# Altium project TYPEC_4KRECEIVER-v1.0.PrjPcb (part 6 of 12)

## Sheet RK3566_SARADC_GPIO.SchDoc
size A4; SheetNumber: 12; SheetTotal: 23
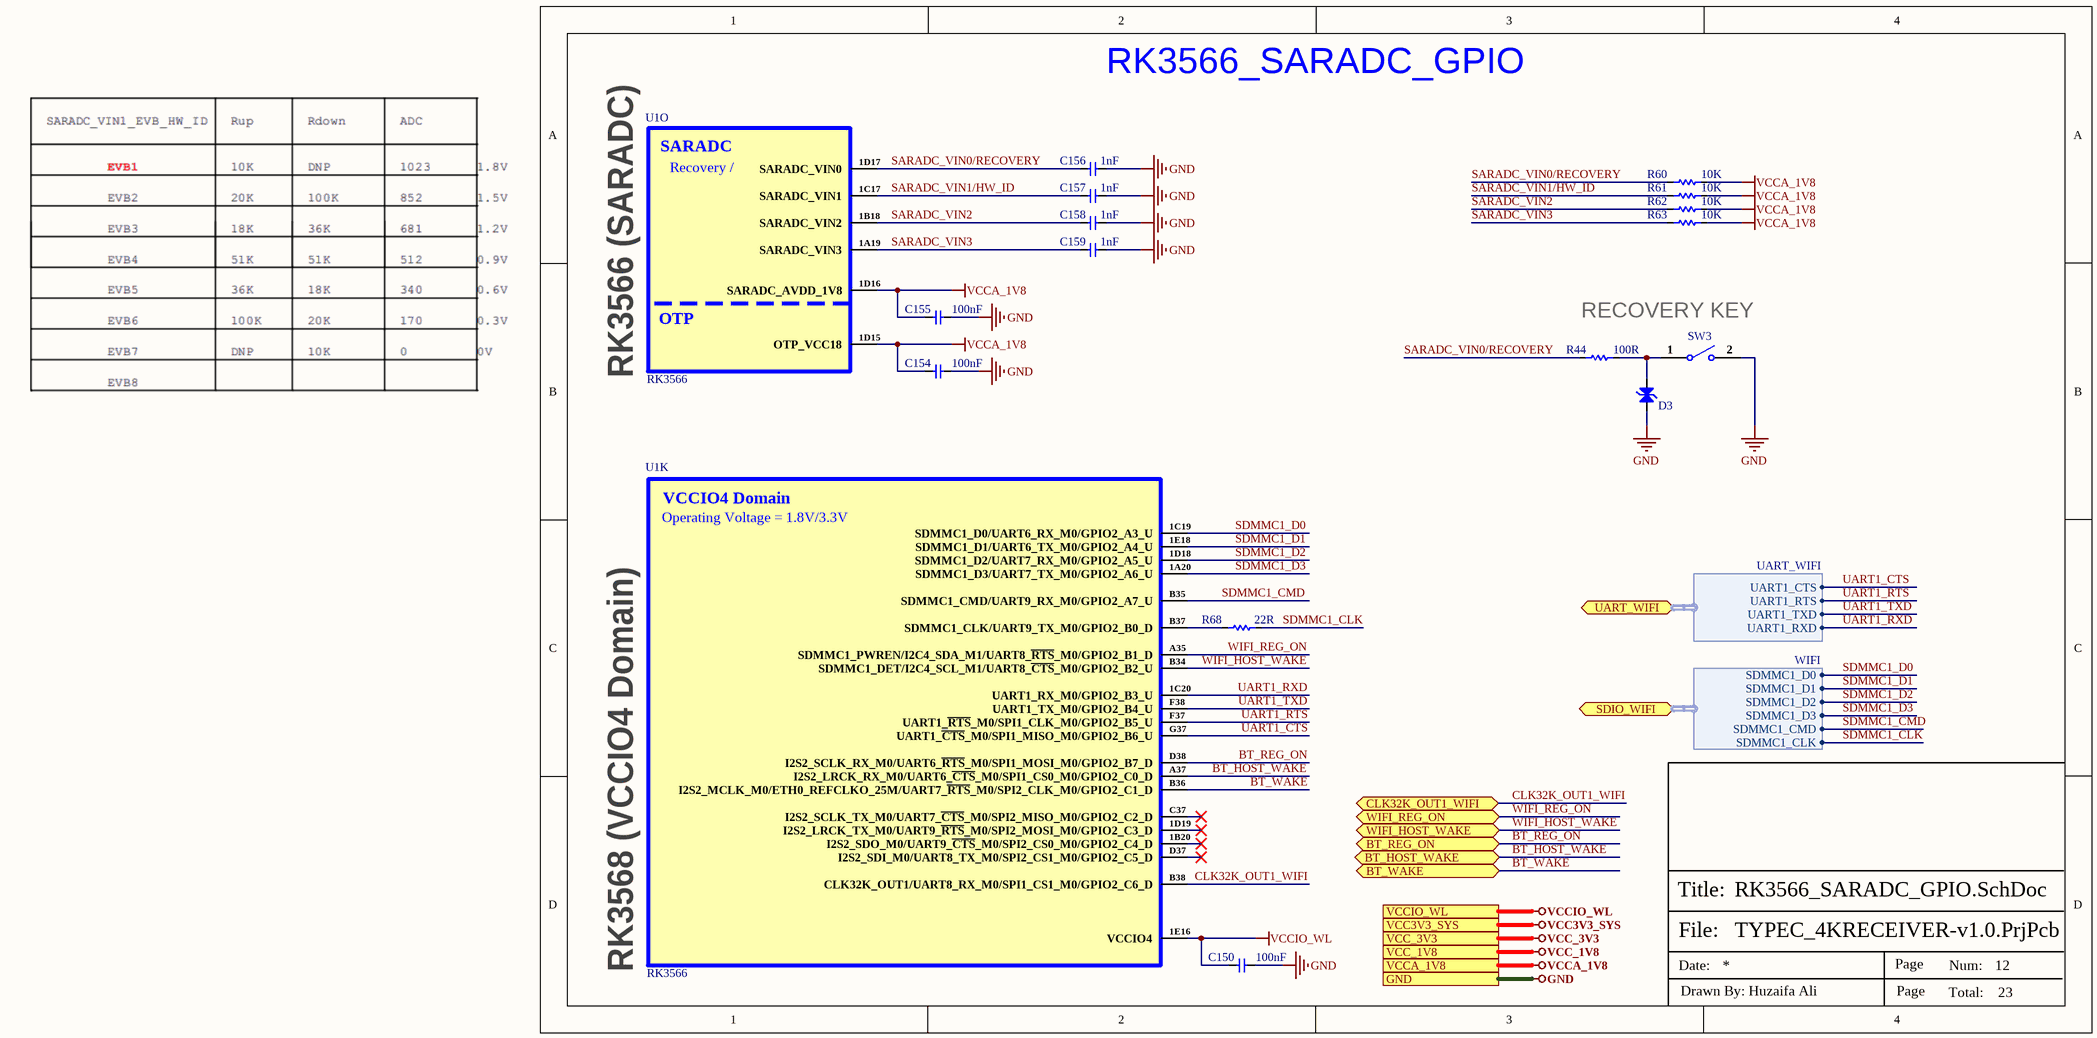
[diagram p12: RK3566_SARADC_GPIO.SchDoc]

### Parts
C150  100nF  [CAP-0201]
C154  100nF  [CAP-0201]
C155  100nF  [CAP-0201]
C156  1nF  [CAP-0201]
C157  1nF  [CAP-0201]
C158  1nF  [CAP-0201]
C159  1nF  [CAP-0201]
D3  ESD5451N  [DFN1006-2L (Bi-Directional)]  (value not drawn)
R44  100R  [Res-0402]
R60  10K  [Res-0201]
R61  10K  [Res-0201]
R62  10K  [Res-0201]
R63  10K  [Res-0201]
R68  22R  [Res-0402]
SW3  B3U-1000P  [B3U-1000P]  (value not drawn)
U1  RK3566  [BGA-565(15.5x14.4)]  (parts K,O of 22)

### Ports
BT_HOST_WAKE (bidir, see WIFI-6_SHEET[3D]), BT_REG_ON (bidir, see WIFI-6_SHEET[3D]), BT_WAKE (bidir, see WIFI-6_SHEET[3D]), CLK32K_OUT1_WIFI (bidir, see WIFI-6_SHEET[3D]), GND (see DRAM_LPDDR4_SHEET[6D], eMMC_SPI-FLASH_SHEET[1D], HDMI2.0_SHEET[3D], POWER_LDO_SHEET[3D], POWER_OTHER_SHEET[3C], POWER_PMIC_RK809_CODEC[3C], POWER_PMIC_RK809_DC DC[3D], POWER_PMIC_RK809_LDO[4C], POWER_PMIC_RK809_MGM[3D], RK3566_AUDIO_SHEET[3C], RK3566_DDR-PHY_SHEET[5D], RK3566_FLASH-SD_SHEET[4C], RK3566_OSC_PMUIO_SHEET[5D], RK3566_POWER_SHEET[3D], RK3566_USB_PCIe_SHEET[3D], RK3566_VI_SHEET[3D], RK3566_VO_SHEET_1[3C], RK3566_VO_SHEET_2[4C], TYPE-C_INTERFACE_SHEET[3D], TYPE-C_TO_MIPI-CSI_SHEET[5D], USB2.0_SHEET[3D], WIFI-6_SHEET[3D]), SDIO_WIFI (bidir, harness WIFI, see WIFI-6_SHEET[2D]), UART_WIFI (bidir, harness UART_WIFI, see WIFI-6_SHEET[1D]), VCC3V3_SYS (see DRAM_LPDDR4_SHEET[6D], POWER_LDO_SHEET[3D], POWER_OTHER_SHEET[3C], POWER_PMIC_RK809_DC DC[3D], POWER_PMIC_RK809_LDO[4C], POWER_PMIC_RK809_MGM[3D], TYPE-C_TO_MIPI-CSI_SHEET[5D], WIFI-6_SHEET[3D]), VCC_1V8 (see POWER_PMIC_RK809_LDO[4C], RK3566_VI_SHEET[3D], WIFI-6_SHEET[3D]), VCC_3V3 (see eMMC_SPI-FLASH_SHEET[1D], HDMI2.0_SHEET[3D], POWER_PMIC_RK809_LDO[4C], RK3566_AUDIO_SHEET[3C], RK3566_USB_PCIe_SHEET[3D], RK3566_VI_SHEET[3D], RK3566_VO_SHEET_2[4C], TYPE-C_TO_MIPI-CSI_SHEET[5D], WIFI-6_SHEET[3D]), VCCA_1V8 (see POWER_PMIC_RK809_LDO[4C], RK3566_OSC_PMUIO_SHEET[5D], RK3566_USB_PCIe_SHEET[3D]), VCCIO_WL (see POWER_PMIC_RK809_MGM[3D], WIFI-6_SHEET[3D]), WIFI_HOST_WAKE (bidir, see WIFI-6_SHEET[3D]), WIFI_REG_ON (bidir, see WIFI-6_SHEET[3D])

### Harnesses
WIFI: SDMMC1_D0, SDMMC1_D1, SDMMC1_D2, SDMMC1_D3, SDMMC1_CMD, SDMMC1_CLK
UART_WIFI: UART1_CTS, UART1_RTS, UART1_TXD, UART1_RXD

### Nets
GND: C150.1 C154.1 C155.1 C156.2 C157.2 C158.2 C159.2 D3.1(K) SW3.2 ; port GND
VCCA_1V8: C154.2 C155.2 R60.2 R61.1 R62.1 R63.1 U1.1D15(OTP_VCC18) U1.1D16(SARADC_AVDD_1V8) ; port VCCA_1V8
VCCIO_WL: C150.2 U1.1E16(VCCIO4) ; port VCCIO_WL
BT_HOST_WAKE: U1.A37(I2S2_LRCK_RX_M0/UART6_~{CTS}_M0/SPI1_CS0_M0/GPIO2_C0_D) ; port BT_HOST_WAKE
BT_REG_ON: U1.D38(I2S2_SCLK_RX_M0/UART6_~{RTS}_M0/SPI1_MOSI_M0/GPIO2_B7_D) ; port BT_REG_ON
BT_WAKE: U1.B36(I2S2_MCLK_M0/ETH0_REFCLKO_25M/UART7_~{RTS}_M0/SPI2_CLK_M0/GPIO2_C1_D) ; port BT_WAKE
CLK32K_OUT1_WIFI: U1.B38(CLK32K_OUT1/UART8_RX_M0/SPI1_CS1_M0/GPIO2_C6_D) ; port CLK32K_OUT1_WIFI
SARADC_VIN0/RECOVERY: C156.1 R44.1 R60.1 U1.1D17(SARADC_VIN0)
SARADC_VIN1/HW_ID: C157.1 R61.2 U1.1C17(SARADC_VIN1)
SARADC_VIN2: C158.1 R62.2 U1.1B18(SARADC_VIN2)
SARADC_VIN3: C159.1 R63.2 U1.1A19(SARADC_VIN3)
SDMMC1_CLK: R68.1 ; port SDIO_WIFI.SDMMC1_CLK
SDMMC1_CMD: U1.B35(SDMMC1_CMD/UART9_RX_M0/GPIO2_A7_U) ; port SDIO_WIFI.SDMMC1_CMD
SDMMC1_D0: U1.1C19(SDMMC1_D0/UART6_RX_M0/GPIO2_A3_U) ; port SDIO_WIFI.SDMMC1_D0
SDMMC1_D1: U1.1E18(SDMMC1_D1/UART6_TX_M0/GPIO2_A4_U) ; port SDIO_WIFI.SDMMC1_D1
SDMMC1_D2: U1.1D18(SDMMC1_D2/UART7_RX_M0/GPIO2_A5_U) ; port SDIO_WIFI.SDMMC1_D2
SDMMC1_D3: U1.1A20(SDMMC1_D3/UART7_TX_M0/GPIO2_A6_U) ; port SDIO_WIFI.SDMMC1_D3
UART1_CTS: U1.G37(UART1_~{CTS}_M0/SPI1_MISO_M0/GPIO2_B6_U) ; port UART_WIFI.UART1_CTS
UART1_RTS: U1.F37(UART1_~{RTS}_M0/SPI1_CLK_M0/GPIO2_B5_U) ; port UART_WIFI.UART1_RTS
UART1_RXD: U1.1C20(UART1_RX_M0/GPIO2_B3_U) ; port UART_WIFI.UART1_RXD
UART1_TXD: U1.F38(UART1_TX_M0/GPIO2_B4_U) ; port UART_WIFI.UART1_TXD
WIFI_HOST_WAKE: U1.B34(SDMMC1_DET/I2C4_SCL_M1/UART8_~{CTS}_M0/GPIO2_B2_U) ; port WIFI_HOST_WAKE
WIFI_REG_ON: U1.A35(SDMMC1_PWREN/I2C4_SDA_M1/UART8_~{RTS}_M0/GPIO2_B1_D) ; port WIFI_REG_ON
NetD3_2: D3.2(K) R44.2 SW3.1
NetR68_2: R68.2 U1.B37(SDMMC1_CLK/UART9_TX_M0/GPIO2_B0_D)

Not connected (* = marked no-connect by the designer): U1 1B20(I2S2_SDO_M0/UART9_~{CTS}_M0/SPI2_CS0_M0/GPIO2_C4_D)* 1D19(I2S2_LRCK_TX_M0/UART9_~{RTS}_M0/SPI2_MOSI_M0/GPIO2_C3_D)* C37(I2S2_SCLK_TX_M0/UART7_~{CTS}_M0/SPI2_MISO_M0/GPIO2_C2_D)* D37(I2S2_SDI_M0/UART8_TX_M0/SPI2_CS1_M0/GPIO2_C5_D)*

### Notes on the sheet
- RK3566_SARADC_GPIO
- RECOVERY KEY
- RK3566 (SARADC)
- RK3568 (VCCIO4 Domain)
- File:
- Title:
- Date:
- Page
- Num:
- Total:
- Drawn By: Huzaifa Ali
- (in symbol RK3566, part K) VCCIO4 Domain; Operating Voltage = 1.8V/3.3V
- (in symbol RK3566, part O) SARADC; Recovery /; OTP

### Library data of the parts
C150 C154 C155 = CC0201KRX5R6BB104: as C108-C113 on sheet RK3566_DDR-PHY_SHEET; Supplier 1: Mouser; Manufacturer Part Number: CC0201KRX5R6BB104; RoHS: Yes; Category: Ceramic Capacitors; Stock 1: 824403; Pricing 1: 1=0.10000, 10=0.02400, 50=0.02400, 100=0.01900, 1000=0.01100, 10000=0.00900 (USD); Mount: Surface Mount; Case/Package: 0201; Case Code (Imperial): 0201; Case Code (Metric): 0603; Weight: 6E-06oz; Min Operating Temperature: -55°C; Max Operating Temperature: 85°C; Capacitance: 100nF; Dielectric: X5R; Voltage Rating (DC): 10V; Packaging: Tape and Reel; Termination: SMD/SMT; Resistor Type: Ceramic; Voltage Rating: 10V; Series: CC; Construction: Flat; Length: 0.6mm; Width: 0.012inch; Height: 0.3mm; Thickness: 0.013inch; Depth: 0.3mm; Radiation Hardening: No; Lead Free: Lead Free; Halogen Free: Halogen Free; RoHS Compliant: Yes; ComponentLink1URL: https://datasheet.ciiva.com/11587/upy-gphc-x5r-4v-to-50v-12-11587190.pdf?src-supplier=Avnet; ComponentLink1Description: https://datasheet.ciiva.com/11587/upy-gphc-x5r-4v-to-50v-12-11587190.pdf?src-supplier=Avnet; Supplier Part Number 1: 603-CC201KRX5R6BB104; LCSC Part Number: C190183
C156-C159 = 0201B102K500NT: 50V 1nF X7R ±10% 0201 Multilayer Ceramic Capacitors MLCC - SMD/SMT ROHS; Manufacturer: FH; Manufacturer Part Number: 0201B102K500NT; ComponentLink1URL: https://www.lcsc.com/product-detail/Multilayer-Ceramic-Capacitors-MLCC-SMD-SMT_FH-Guangdong-Fenghua-Advanced-Tech-0201B102K500NT_C66942.html; ComponentLink1Description: LCSC; LCSC Part Number: C66942; Item Type: Capacitor; Value: 1nF
D3 = ESD5451N: DFN1006-2(0402) ESD Protection Devices ROHS; Manufacturer: TECH PUBLIC; Manufacturer Part Number: ESD5451N; Footprint: DFN1006-2(0402); ComponentLink1Description: LCSC; ComponentLink1URL: https://www.lcsc.com/product-detail/span-style-background-color-ff0-ESD-span-Protection-Devices_TECH-PUBLIC-ESD5451N_C2936977.html; LCSC Part Number: C2936977
R44 = RC0402FR-07100RL: RES 100 OHM 1% 1/16W 0402; Manufacturer: Yageo; Power Rating: 62.5mW; Voltage Rating: 50V; Temperature Coefficient: 100ppm/°C; Max Power Dissipation: 63mW; Item Type: Resistor; Supplier 1: Mouser; Manufacturer Part Number: RC0402FR-07100RL; RoHS: Yes; Category: Chip SMD Resistors; Stock 1: 699545; Pricing 1: 1=0.10000, 10=0.01200, 50=0.01200, 100=0.00500, 1000=0.00300, 2500=0.00200, 10000=0.00100 (USD); Case/Package: 0402; Number of Pins: 2; Case Code (Imperial): 0402; Case Code (Metric): 1005; Size Code: 0402; Min Operating Temperature: -55°C; Max Operating Temperature: 155°C; Tolerance: 1%; Voltage Rating (DC): 50V; Resistance: 100R; Packaging: Tape and Reel; Termination: SMD/SMT; Resistor Type: Thick Film; Features: Moisture Resistant; Series: RC; Number of Terminations: 2; Resistance Tolerance: 1%; Construction: Rectangular; Technology: THICK FILM; Length: 1mm; Width: 0.5mm; Height: 0.32mm; Depth: 0.5mm; RoHS Compliant: Yes; REACH SVHC: No SVHC; Military Standard: Not; Lead Free: Lead Free; ComponentLink1URL: https://datasheet.ciiva.com/11808/0900766b80c66297-11808765.pdf?src-supplier=RSComponents; ComponentLink1Description: https://datasheet.ciiva.com/11808/0900766b80c66297-11808765.pdf?src-supplier=RSComponents; ComponentLink2URL: https://datasheet.ciiva.com/7849/1784430-7849810.pdf?src-supplier=Element14; ComponentLink2Description: https://datasheet.ciiva.com/7849/1784430-7849810.pdf?src-supplier=Element14; ComponentLink3URL: https://datasheet.ciiva.com/28367/1018594-28367226.pdf?src-supplier=Element14; ComponentLink3Description: https://datasheet.ciiva.com/28367/1018594-28367226.pdf?src-supplier=Element14; ComponentLink4URL: https://datasheet.ciiva.com/22747/1018594-22747511.pdf?src-supplier=Element14; ComponentLink4Description: https://datasheet.ciiva.com/22747/1018594-22747511.pdf?src-supplier=Element14; ComponentLink5URL: https://datasheet.ciiva.com/12667/pyu-rc0402-51-rohs-l-6-r-12667957.pdf?src-supplier=Mouser; ComponentLink5Description: https://datasheet.ciiva.com/12667/pyu-rc0402-51-rohs-l-6-r-12667957.pdf?src-supplier=Mouser; ComponentLink6URL: https://datasheet.ciiva.com/15189/getdatasheetpartid-329466-15189335.pdf?src-supplier=Verical; ComponentLink6Description: https://datasheet.ciiva.com/15189/getdatasheetpartid-329466-15189335.pdf?src-supplier=Verical; ComponentLink7URL: https://datasheet.ciiva.com/16740/pyu-rc0402-51-rohs-l-6-r-16740566.pdf?src-supplier=Future+Electronics; ComponentLink7Description: https://datasheet.ciiva.com/16740/pyu-rc0402-51-rohs-l-6-r-16740566.pdf?src-supplier=Future+Electronics; Supplier Part Number 1: 603-RC0402FR-07100RL; LCSC Part Number: C106232
R60-R63 = RC0201FR-0710KL: RES SMD 10K OHM 1% 1/20W 0201; Manufacturer: Yageo; Item Type: Resistor; Manufacturer Part Number: RC0201FR-0710KL; ComponentLink7URL: https://www.lcsc.com/product-detail/Chip-Resistor-Surface-Mount_YAGEO-RC0201FR-0710KL_C106225.html; ComponentLink7Description: LCSC; LCSC Part Number: C106225; Package: 0201
R68 = RC0402FR-0722RL: RES 22 OHM 1% 1/16W 0402; Manufacturer: Yageo; Voltage Rating: 50V; Power Rating: 62.5mW; Temperature Coefficient: 100ppm/°C; Max Power Dissipation: 63mW; Item Type: Resistor; Supplier 1: Avnet; Manufacturer Part Number: RC0402FR-0722RL; RoHS: Yes; Category: Chip SMD Resistors; Stock 1: 1810000; Pricing 1: 10000=0.00085 (USD); Case/Package: 0402; Number of Pins: 2; Case Code (Imperial): 0402; Case Code (Metric): 1005; Size Code: 0402; Min Operating Temperature: -55°C; Max Operating Temperature: 155°C; Resistor Type: Thick Film; Voltage Rating (DC): 50V; Resistance: 22R; Tolerance: 1%; Packaging: Tape and Reel; Termination: SMD/SMT; Features: Moisture Resistant; Series: RC; Number of Terminations: 2; Resistance Tolerance: 1%; Technology: THICK FILM; Construction: Rectangular; Length: 1mm; Width: 0.5mm; Height: 0.32mm; Depth: 0.5mm; RoHS Compliant: Yes; Reach SVHC Compliant: Yes; Military Standard: Not; Lead Free: Lead Free; ComponentLink1URL: https://datasheet.ciiva.com/11819/0900766b80c66297-11819462.pdf?src-supplier=RSComponents; ComponentLink1Description: https://datasheet.ciiva.com/11819/0900766b80c66297-11819462.pdf?src-supplier=RSComponents; ComponentLink2URL: https://datasheet.ciiva.com/7849/1018594-7849912.pdf?src-supplier=Element14; ComponentLink2Description: https://datasheet.ciiva.com/7849/1018594-7849912.pdf?src-supplier=Element14; ComponentLink3URL: https://datasheet.ciiva.com/7849/1018594-7849911.pdf?src-supplier=Element14; ComponentLink3Description: https://datasheet.ciiva.com/7849/1018594-7849911.pdf?src-supplier=Element14; ComponentLink4URL: https://datasheet.ciiva.com/16930/pyu-rc0402-51-rohs-l-6-r-16930687.pdf?src-supplier=Future+Electronics; ComponentLink4Description: https://datasheet.ciiva.com/16930/pyu-rc0402-51-rohs-l-6-r-16930687.pdf?src-supplier=Future+Electronics; ComponentLink5URL: https://datasheet.ciiva.com/26829/getdatasheetpartid-554995-26829991.pdf?src-supplier=Verical; ComponentLink5Description: https://datasheet.ciiva.com/26829/getdatasheetpartid-554995-26829991.pdf?src-supplier=Verical; Supplier Part Number 1: RC0402FR-0722RL; LCSC Part Number: C114765
SW3 = B3U-1000P: SWITCH TACTILE SPST-NO 0.05A 12V; Manufacturer: Omron; Mechanical Life: 200000Cycles; Operating Force: 1.5N; Throw Configuration: SPST; Current Rating: 50mA; Contact Resistance: 100mR; Illumination Type: Non-Illuminated,Illuminated; Switch Travel: 0.15mm; Switch Function: Off-Mom; Actuator Type: Standard; Actuator Length: 0.4mm; Ratings: Dust Proof,IP40; ComponentLink1URL: http://www.farnell.com/datasheets/60838.pdf?src-supplier=Farnell; ComponentLink1Description: http://www.farnell.com/datasheets/60838.pdf?src-supplier=Farnell; ComponentLink2URL: http://www.farnell.com/datasheets/60838.pdf?src-supplier=Element14; ComponentLink2Description: http://www.farnell.com/datasheets/60838.pdf?src-supplier=Element14; ComponentLink3URL: https://omronfs.omron.com/en_US/ecb/products/pdf/en-b3u.pdf?src-supplier=Digi-Key; ComponentLink3Description: https://omronfs.omron.com/en_US/ecb/products/pdf/en-b3u.pdf?src-supplier=Digi-Key; ComponentLink4URL: http://www.omron.com/ecb/products/pdf/en-b3u.pdf?src-supplier=Digi-Key; ComponentLink4Description: http://www.omron.com/ecb/products/pdf/en-b3u.pdf?src-supplier=Digi-Key; ComponentLink5URL: https://www.distrelec.biz/Web/Downloads/he/et/B3U_eng_datasheet.pdf?mime=application%2Fpdf&src-supplier=Distrelec; ComponentLink5Description: https://www.distrelec.biz/Web/Downloads/he/et/B3U_eng_datasheet.pdf?mime=application%2Fpdf&src-supplier=Distrelec; ComponentLink6URL: http://www.onlinecomponents.com/productFiles/mf-OM/en-b3u.pdf?src-supplier=Onlinecomponents.com; ComponentLink6Description: http://www.onlinecomponents.com/productFiles/mf-OM/en-b3u.pdf?src-supplier=Onlinecomponents.com; Supplier 1: Digi-Key; Manufacturer Part Number: B3U-1000P; Stock 1: 116454; Pricing 1: 1=1, 10=0.961, 25=0.9064, 50=0.7976, 100=0.7251, 250=0.68888, 500=0.67074, 1000=0.52571 (USD); Mount: Surface Mount; Weight: 0.000776oz; Contact Material: Silver; Min Operating Temperature: -25°C; Max Operating Temperature: 70°C; Packaging: Tape and Reel; Voltage Rating (DC): 12V; Package Quantity: 1; Max Current Rating: 50mA; Termination: SMD/SMT; Orientation: Straight; Max Voltage Rating (DC): 12V; Electrical Life: 200000Cycles; Insulation Resistance: 100MR; Contact Current Rating: 50mA; Length: 4mm; Height: 1.2mm; Depth: 2.5mm; Width: 3mm; REACH SVHC: Unknown; Lead Free: Lead Free; ComponentLink7URL: https://www.verical.com/server-webapp/html/getDatasheet?partID=552554&src-supplier=Verical; ComponentLink7Description: https://www.verical.com/server-webapp/html/getDatasheet?partID=552554&src-supplier=Verical; ComponentLink8URL: http://www.farnell.com/datasheets/1685550.pdf?src-supplier=Element14; ComponentLink8Description: http://www.farnell.com/datasheets/1685550.pdf?src-supplier=Element14; ComponentLink9URL: http://www.farnell.com/datasheets/2610940.pdf?src-supplier=Farnell; ComponentLink9Description: http://www.farnell.com/datasheets/2610940.pdf?src-supplier=Farnell; ComponentLink10URL: https://www.alliedelec.com/m/d/4c8a9ef82804fc3c241a13c1e298fd73.pdf?src-supplier=Allied+Electronics; ComponentLink10Description: https://www.alliedelec.com/m/d/4c8a9ef82804fc3c241a13c1e298fd73.pdf?src-supplier=Allied+Electronics; Supplier Part Number 1: SW1020DKR-ND; LCSC Part Number: C231329; Item Type: Switch
U1 = RK3566: BGA-565(15.5x14.4) Microcontrollers (MCU/MPU/SOC) ROHS; Manufacturer: Rockchip; Item Type: IC; Manufacturer Part Number: RK3566; Package: BGA-565(15.5x14.4); LCSC Part Number: C2943786; ComponentLink1Description: LCSC; ComponentLink1URL: https://www.lcsc.com/product-detail/Microcontrollers-MCU-MPU-SOC_Rockchip-RK3566_C2943786.html

## Sheet RK3566_USB_PCIe_SHEET.SchDoc
size A4; SheetNumber: 13; SheetTotal: 23
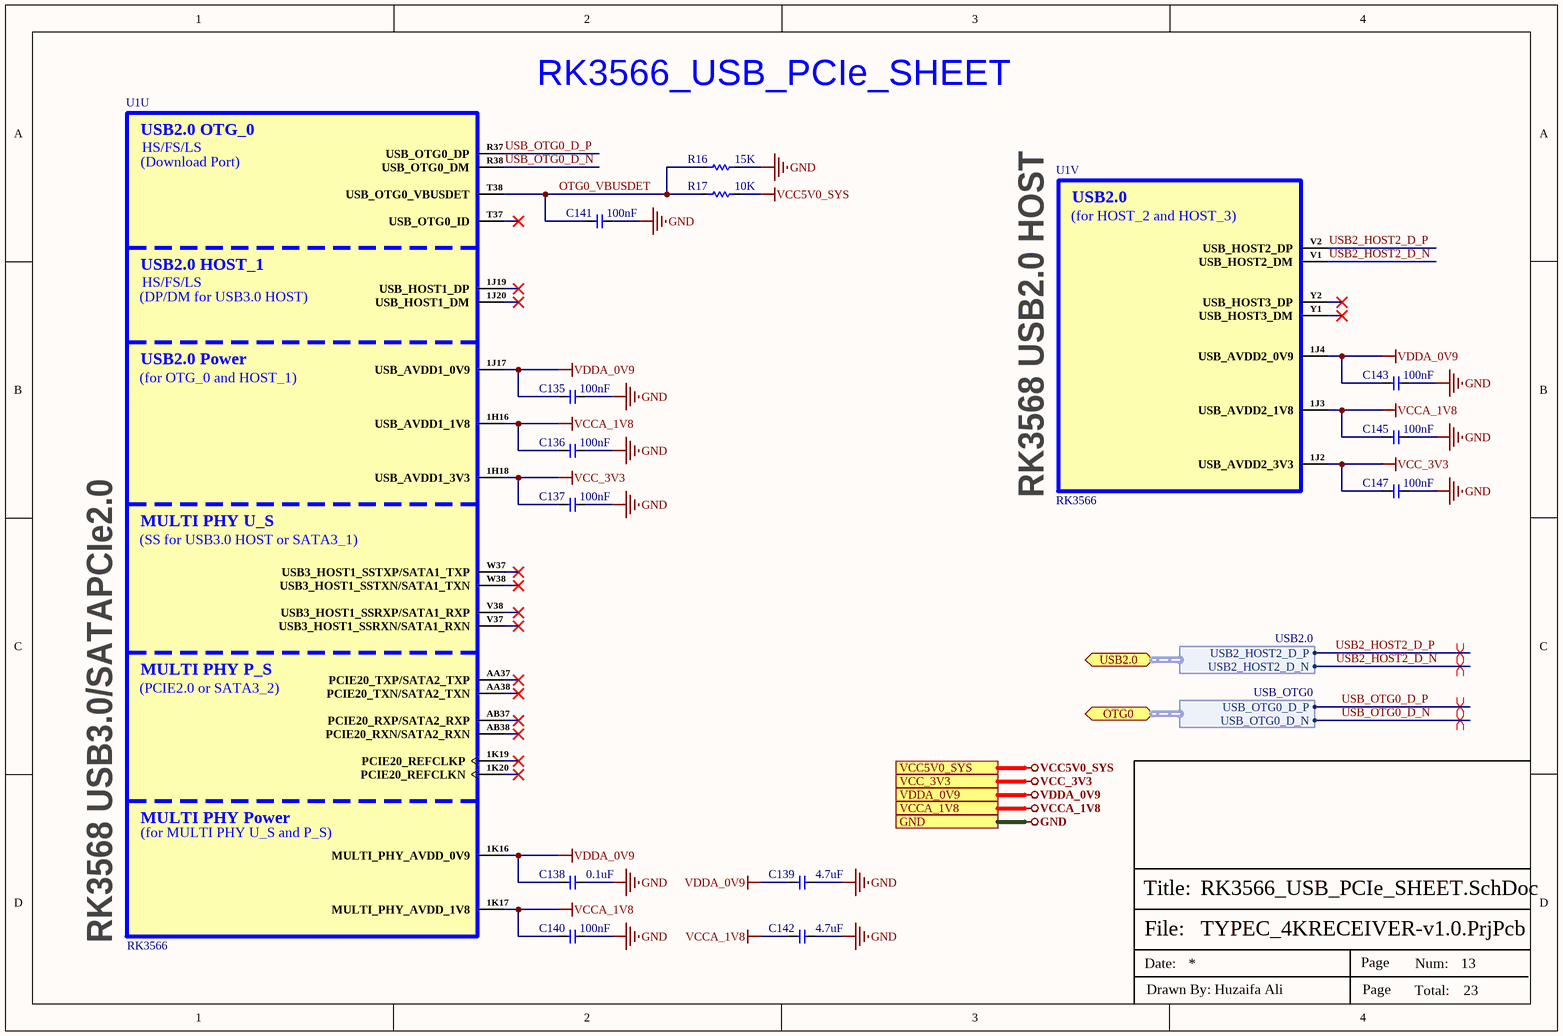
[diagram p13: RK3566_USB_PCIe_SHEET.SchDoc]

### Parts
C135  100nF  [CAP-0201]
C136  100nF  [CAP-0201]
C137  100nF  [CAP-0201]
C138  0.1uF  [Cap-0402]
C139  4.7uF  [Cap-0402]
C140  100nF  [CAP-0201]
C141  100nF  [Cap-0402]
C142  4.7uF  [Cap-0402]
C143  100nF  [CAP-0201]
C145  100nF  [CAP-0201]
C147  100nF  [CAP-0201]
R16  15K  [Res-0402]
R17  10K  [Res-0402]
U1  RK3566  [BGA-565(15.5x14.4)]  (parts U,V of 22)

### Ports
GND (see DRAM_LPDDR4_SHEET[6D], eMMC_SPI-FLASH_SHEET[1D], HDMI2.0_SHEET[3D], POWER_LDO_SHEET[3D], POWER_OTHER_SHEET[3C], POWER_PMIC_RK809_CODEC[3C], POWER_PMIC_RK809_DC DC[3D], POWER_PMIC_RK809_LDO[4C], POWER_PMIC_RK809_MGM[3D], RK3566_AUDIO_SHEET[3C], RK3566_DDR-PHY_SHEET[5D], RK3566_FLASH-SD_SHEET[4C], RK3566_OSC_PMUIO_SHEET[5D], RK3566_POWER_SHEET[3D], RK3566_SARADC_GPIO[3D], RK3566_VI_SHEET[3D], RK3566_VO_SHEET_1[3C], RK3566_VO_SHEET_2[4C], TYPE-C_INTERFACE_SHEET[3D], TYPE-C_TO_MIPI-CSI_SHEET[5D], USB2.0_SHEET[3D], WIFI-6_SHEET[3D]), OTG0 (bidir, harness USB_OTG0, see TYPE-C_INTERFACE_SHEET[2D]), USB2.0 (bidir, harness USB2.0, see USB2.0_SHEET[2D]), VCC5V0_SYS (see HDMI2.0_SHEET[3D], POWER_LDO_SHEET[3D], POWER_OTHER_SHEET[3C], POWER_PMIC_RK809_CODEC[3C], POWER_PMIC_RK809_MGM[3D], TYPE-C_INTERFACE_SHEET[3D], USB2.0_SHEET[3D]), VCC_3V3 (see eMMC_SPI-FLASH_SHEET[1D], HDMI2.0_SHEET[3D], POWER_PMIC_RK809_LDO[4C], RK3566_AUDIO_SHEET[3C], RK3566_SARADC_GPIO[3D], RK3566_VI_SHEET[3D], RK3566_VO_SHEET_2[4C], TYPE-C_TO_MIPI-CSI_SHEET[5D], WIFI-6_SHEET[3D]), VCCA_1V8 (see POWER_PMIC_RK809_LDO[4C], RK3566_OSC_PMUIO_SHEET[5D], RK3566_SARADC_GPIO[3D]), VDDA_0V9 (see POWER_PMIC_RK809_LDO[4C], RK3566_OSC_PMUIO_SHEET[5D])

### Harnesses
USB2.0: USB2_HOST2_D_P, USB2_HOST2_D_N
USB_OTG0: USB_OTG0_D_P, USB_OTG0_D_N

### Nets
GND: C135.1 C136.1 C137.1 C138.1 C139.1 C140.1 C141.1 C142.1 C143.1 C145.1 C147.1 R16.1 ; port GND
VCC5V0_SYS: R17.2 ; port VCC5V0_SYS
VCC_3V3: C137.2 C147.2 U1.1H18(USB_AVDD1_3V3) U1.1J2(USB_AVDD2_3V3) ; port VCC_3V3
VCCA_1V8: C136.2 C140.2 C142.2 C145.2 U1.1H16(USB_AVDD1_1V8) U1.1J3(USB_AVDD2_1V8) U1.1K17(MULTI_PHY_AVDD_1V8) ; port VCCA_1V8
VDDA_0V9: C135.2 C138.2 C139.2 C143.2 U1.1J4(USB_AVDD2_0V9) U1.1J17(USB_AVDD1_0V9) U1.1K16(MULTI_PHY_AVDD_0V9) ; port VDDA_0V9
OTG0_VBUSDET: C141.2 R16.2 R17.1 U1.T38(USB_OTG0_VBUSDET)
USB2_HOST2_D_N: U1.V1(USB_HOST2_DM) ; port USB2.0.USB2_HOST2_D_N
USB2_HOST2_D_P: U1.V2(USB_HOST2_DP) ; port USB2.0.USB2_HOST2_D_P
USB_OTG0_D_N: U1.R38(USB_OTG0_DM) ; port OTG0.USB_OTG0_D_N
USB_OTG0_D_P: U1.R37(USB_OTG0_DP) ; port OTG0.USB_OTG0_D_P

Not connected (* = marked no-connect by the designer): U1 1J19(USB_HOST1_DP)* 1J20(USB_HOST1_DM)* 1K19(PCIE20_REFCLKP)* 1K20(PCIE20_REFCLKN)* AA37(PCIE20_TXP/SATA2_TXP)* AA38(PCIE20_TXN/SATA2_TXN)* AB37(PCIE20_RXP/SATA2_RXP)* AB38(PCIE20_RXN/SATA2_RXN)* T37(USB_OTG0_ID)* V37(USB3_HOST1_SSRXN/SATA1_RXN)* V38(USB3_HOST1_SSRXP/SATA1_RXP)* W37(USB3_HOST1_SSTXP/SATA1_TXP)* W38(USB3_HOST1_SSTXN/SATA1_TXN)* Y1(USB_HOST3_DM)* Y2(USB_HOST3_DP)*

### Layout directives
differential pair: USB2_HOST2_D_N, USB2_HOST2_D_P, USB_OTG0_D_N, USB_OTG0_D_P

### Notes on the sheet
- RK3566_USB_PCIe_SHEET
- RK3568 USB2.0 HOST
- RK3568 USB3.0/SATAPCIe2.0
- File:
- Title:
- Date:
- Page
- Num:
- Total:
- Drawn By: Huzaifa Ali
- (in symbol RK3566, part U) USB2.0 OTG_0; HS/FS/LS; (Download Port); USB2.0 HOST_1; (DP/DM for USB3.0 HOST); USB2.0 Power; (for OTG_0 and HOST_1); MULTI PHY U_S; (SS for USB3.0 HOST or SATA3_1); MULTI PHY P_S; (PCIE2.0 or SATA3_2); MULTI PHY Power; (for MULTI PHY U_S and P_S)
- (in symbol RK3566, part V) USB2.0; (for HOST_2 and HOST_3)

### Library data of the parts
C135-C137 C140 C143 C145 C147 = CC0201KRX5R6BB104: as C108-C113 on sheet RK3566_DDR-PHY_SHEET; Supplier 1: Mouser; Manufacturer Part Number: CC0201KRX5R6BB104; RoHS: Yes; Category: Ceramic Capacitors; Stock 1: 824403; Pricing 1: 1=0.10000, 10=0.02400, 50=0.02400, 100=0.01900, 1000=0.01100, 10000=0.00900 (USD); Mount: Surface Mount; Case/Package: 0201; Case Code (Imperial): 0201; Case Code (Metric): 0603; Weight: 6E-06oz; Min Operating Temperature: -55°C; Max Operating Temperature: 85°C; Capacitance: 100nF; Dielectric: X5R; Voltage Rating (DC): 10V; Packaging: Tape and Reel; Termination: SMD/SMT; Resistor Type: Ceramic; Voltage Rating: 10V; Series: CC; Construction: Flat; Length: 0.6mm; Width: 0.012inch; Height: 0.3mm; Thickness: 0.013inch; Depth: 0.3mm; Radiation Hardening: No; Lead Free: Lead Free; Halogen Free: Halogen Free; RoHS Compliant: Yes; ComponentLink1URL: https://datasheet.ciiva.com/11587/upy-gphc-x5r-4v-to-50v-12-11587190.pdf?src-supplier=Avnet; ComponentLink1Description: https://datasheet.ciiva.com/11587/upy-gphc-x5r-4v-to-50v-12-11587190.pdf?src-supplier=Avnet; Supplier Part Number 1: 603-CC201KRX5R6BB104; LCSC Part Number: C190183
C138 = CC0402JRX7R7BB104: CAP CER 0.1UF 16V X7R 0402; Manufacturer: Yageo; Tolerance: 5%; Material: 4241ConductorMaterial; Value: 100nF; Item Type: Capacitor; Manufacturer Part Number: CC0402JRX7R7BB104; RoHS: Yes; Category: Ceramic Capacitors; Case/Package: 0402; Case Code (Imperial): 0402; Case Code (Metric): 1005; Min Operating Temperature: -55°C; Max Operating Temperature: 125°C; Dielectric: X7R; Voltage Rating (DC): 16V; Packaging: Tape and Reel; Voltage Rating: 16V; Series: CC; Construction: Flat; Length: 0.039inch; Width: 0.02inch; Height: 0.5mm; Thickness: 0.022inch; Lead Free: Lead Free; Halogen Free: Halogen Free; RoHS Compliant: Yes; ComponentLink1URL: https://datasheet.ciiva.com/13210/upy-gphc-x7r-6-3v-to-50v-8-12304-13210152.pdf?src-supplier=Mouser; ComponentLink1Description: https://datasheet.ciiva.com/13210/upy-gphc-x7r-6-3v-to-50v-8-12304-13210152.pdf?src-supplier=Mouser; LCSC Part Number: C541464; Supplier: Digikey; Supplier Part Number: 311-1676-1-ND; Stock: 1659111; Pricing: 1=0.1, 10=0.046, 50=0.0262, 100=0.0203, 500=0.01528, 1000=0.012, 2500=0.01091, 5000=0.01004 (USD); Mounting Technology: Surface Mount; Package Quantity: 10000
C139 C142 = CC0402KRX5R5BB475: CAP CER 4.7UF 6.3V X5R 0402; Manufacturer: Yageo; Tolerance: 10%; Item Type: Capacitor; Supplier 1: Arrow Electronics; Manufacturer Part Number: CC0402KRX5R5BB475; RoHS: Yes; Category: Ceramic Capacitors; Stock 1: 890000; Pricing 1: 10000=0.02120, 20000=0.02030, 30000=0.02010, 50000=0.01930, 100000=0.01760, 250000=0.01630 (USD); Case/Package: 0402; Voltage Rating (DC): 6.3V; Dielectric: X5R; Capacitance: 4.7uF; Lead Free: Lead Free; Halogen Free: Halogen Free; RoHS Compliant: Yes; ComponentLink1URL: http://www.yageo.com/documents/recent/UPY-GPHC_X5R_4V-to-50V_25.pdf?src-supplier=Digi-Key; ComponentLink1Description: http://www.yageo.com/documents/recent/UPY-GPHC_X5R_4V-to-50V_25.pdf?src-supplier=Digi-Key; ComponentLink2URL: https://www.yageo.com/upload/media/product/productsearch/datasheet/mlcc/UPY-GPHC_X5R_4V-to-50V_26.pdf?src-supplier=Digi-Key; ComponentLink2Description: https://www.yageo.com/upload/media/product/productsearch/datasheet/mlcc/UPY-GPHC_X5R_4V-to-50V_26.pdf?src-supplier=Digi-Key; LCSC Part Number: C541466; Supplier Part Number 1: CC0402KRX5R5BB475
C141 = CC0402KRX5R7BB104: CAP CER 0.1UF 16V X5R 0402; Manufacturer: Yageo; Tolerance: 10%; Supplier 1: Mouser; Manufacturer Part Number: CC0402KRX5R7BB104; RoHS: Yes; Category: Ceramic Capacitors; Stock 1: 936792; Pricing 1: 1=0.10000, 10=0.02300, 50=0.02300, 100=0.01100, 1000=0.00600, 10000=0.00400 (USD); Mount: Surface Mount; Case/Package: 0402; Case Code (Imperial): 0402; Case Code (Metric): 1005; Min Operating Temperature: -55°C; Max Operating Temperature: 85°C; Capacitance: 100nF; Dielectric: X5R; Voltage Rating (DC): 16V; Packaging: Tape and Reel; Termination: SMD/SMT; Resistor Type: Ceramic; Voltage Rating: 16V; Series: CC; Construction: Flat; Length: 1mm; Width: 0.02inch; Height: 0.5mm; Thickness: 0.022inch; Depth: 0.5mm; Radiation Hardening: No; Lead Free: Lead Free; Halogen Free: Halogen Free; RoHS Compliant: Yes; ComponentLink1URL: https://datasheet.ciiva.com/155/mlccorderingcode-155879.pdf?src-supplier=Digi-Key; ComponentLink1Description: https://datasheet.ciiva.com/155/mlccorderingcode-155879.pdf?src-supplier=Digi-Key; Supplier Part Number 1: 603-CC402KRX5R7BB104; LCSC Part Number: C106204; Number of Pins: 2; Package Quantity: 1; REACH SVHC: Unknown; ComponentLink2URL: https://datasheet.ciiva.com/155/mlccorderingcode-155878.pdf?src-supplier=Digi-Key; ComponentLink2Description: https://datasheet.ciiva.com/155/mlccorderingcode-155878.pdf?src-supplier=Digi-Key; ComponentLink3URL: https://datasheet.ciiva.com/155/mlccorderingcode-155880.pdf?src-supplier=Digi-Key; ComponentLink3Description: https://datasheet.ciiva.com/155/mlccorderingcode-155880.pdf?src-supplier=Digi-Key; ComponentLink4URL: https://datasheet.ciiva.com/11464/upy-gphc-x5r-4v-to-50v-12-11464869.pdf?src-supplier=Avnet; ComponentLink4Description: https://datasheet.ciiva.com/11464/upy-gphc-x5r-4v-to-50v-12-11464869.pdf?src-supplier=Avnet
R16 = RT0402BRD0715KL: RES SMD 15K OHM 0.1% 1/16W 0402; Manufacturer: Yageo; Item Type: Resistor; Supplier: Arrow Electronics; Supplier Part Number: RT0402BRD0715KL; Manufacturer Part Number: RT0402BRD0715KL; RoHS: Yes; Category: Chip SMD Resistors; Stock: 10000; Pricing: 10000=0.0361, 30000=0.0357, 50000=0.0243, 100000=0.0205 (USD); ComponentLink1URL: https://datasheet.ciiva.com/12723/pyu-rt-1-to-0-05-rohs-l-4-12723782.pdf?src-supplier=Mouser; ComponentLink1Description: https://datasheet.ciiva.com/12723/pyu-rt-1-to-0-05-rohs-l-4-12723782.pdf?src-supplier=Mouser; ComponentLink2URL: https://datasheet.ciiva.com/2582/pyu-rt-1-to-0-05-rohs-l-5-2582151.pdf?src-supplier=Digi-Key; ComponentLink2Description: https://datasheet.ciiva.com/2582/pyu-rt-1-to-0-05-rohs-l-5-2582151.pdf?src-supplier=Digi-Key; LCSC Part Number: C852545
R17 = RC0402FR-0710KL: RES 10K OHM 1% 1/16W 0402; Manufacturer: Yageo; Max Power Dissipation: 63mW; Temperature Coefficient: 100ppm/°C; Resistance: 10kR; Voltage Rating (DC): 50V; Power Rating: 62.5mW; Item Type: Resistor; Manufacturer Part Number: RC0402FR-0710KL; RoHS: Yes; Category: Chip SMD Resistors; Case/Package: 0402; Case Code (Imperial): 0402; Case Code (Metric): 1005; Min Operating Temperature: -55°C; Max Operating Temperature: 155°C; Features: Moisture Resistant; Packaging: Tape and Reel; Tolerance: 1%; Number of Terminations: 2; Series: RC; RoHS Compliant: Yes; ComponentLink1URL: https://datasheet.ciiva.com/7660/38568-7660787.pdf?src-supplier=Element14; ComponentLink1Description: https://datasheet.ciiva.com/7660/38568-7660787.pdf?src-supplier=Element14; Supplier 1: Mouser; Stock 1: 18648329; Pricing 1: 1=0.10000, 10=0.01400, 50=0.01400, 100=0.00500, 1000=0.00300, 10000=0.00200 (USD); Number of Pins: 2; Resistor Type: Thick Film; Voltage Rating: 50V; Termination: SMD/SMT; Resistance Tolerance: 1%; Construction: Rectangular; Length: 1mm; Width: 0.5mm; Height: 0.32mm; Depth: 0.5mm; Lead Pitch: 0.2mm; REACH SVHC: No SVHC; Lead Free: Lead Free; Military Standard: Not; ComponentLink2URL: https://datasheet.ciiva.com/7849/1686128-7849814.pdf?src-supplier=Element14; ComponentLink2Description: https://datasheet.ciiva.com/7849/1686128-7849814.pdf?src-supplier=Element14; ComponentLink3URL: https://datasheet.ciiva.com/7983/1018594-7983486.pdf?src-supplier=Element14; ComponentLink3Description: https://datasheet.ciiva.com/7983/1018594-7983486.pdf?src-supplier=Element14; ComponentLink4URL: https://datasheet.ciiva.com/22747/1018594-22747512.pdf?src-supplier=Element14; ComponentLink4Description: https://datasheet.ciiva.com/22747/1018594-22747512.pdf?src-supplier=Element14; ComponentLink5URL: https://datasheet.ciiva.com/12667/pyu-rc0402-51-rohs-l-6-r-12667067.pdf?src-supplier=Mouser; ComponentLink5Description: https://datasheet.ciiva.com/12667/pyu-rc0402-51-rohs-l-6-r-12667067.pdf?src-supplier=Mouser; ComponentLink6URL: https://datasheet.ciiva.com/7849/1784430-7849813.pdf?src-supplier=Element14; ComponentLink6Description: https://datasheet.ciiva.com/7849/1784430-7849813.pdf?src-supplier=Element14; Supplier Part Number 1: 603-RC0402FR-0710KL; LCSC Part Number: C60490; Working Voltage: 50V; ComponentLink7URL: https://datasheet.ciiva.com/7849/1784430-7849815.pdf?src-supplier=Element14; ComponentLink7Description: https://datasheet.ciiva.com/7849/1784430-7849815.pdf?src-supplier=Element14
U1 = RK3566: as U1 on sheet RK3566_SARADC_GPIO; Manufacturer Part Number: RK3566; Package: BGA-565(15.5x14.4); LCSC Part Number: C2943786; ComponentLink1Description: LCSC; ComponentLink1URL: https://www.lcsc.com/product-detail/Microcontrollers-MCU-MPU-SOC_Rockchip-RK3566_C2943786.html

## Sheet RK3566_VI_SHEET.SchDoc
size A4; SheetNumber: 14; SheetTotal: 23
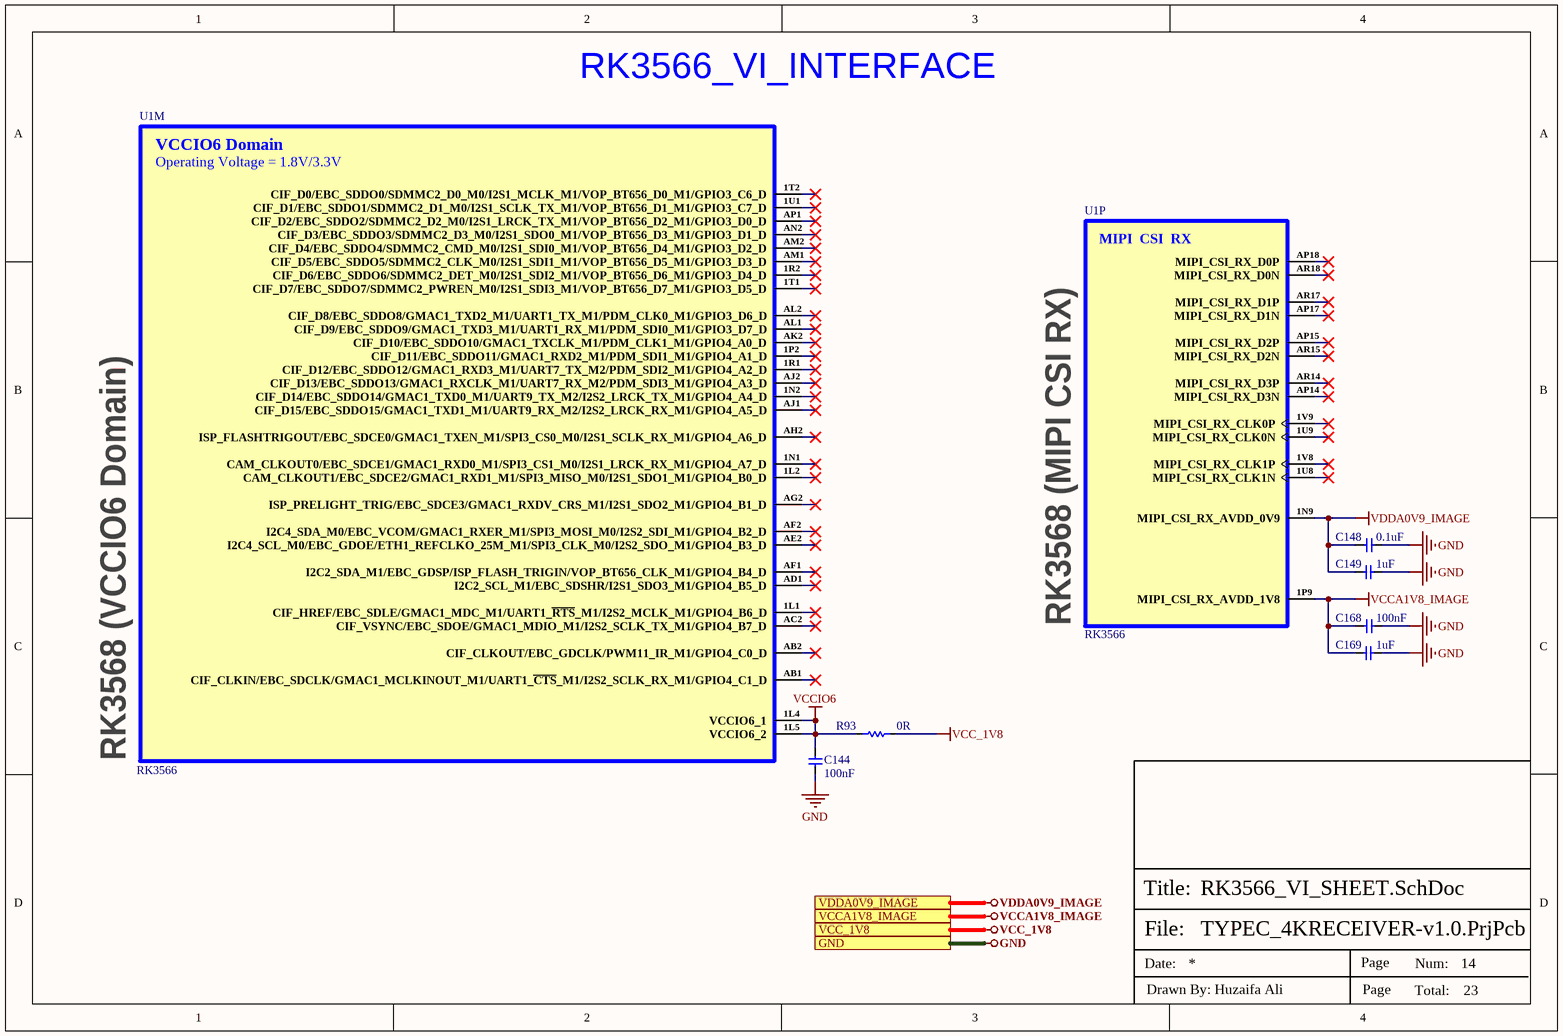
[diagram p14: RK3566_VI_SHEET.SchDoc]

### Parts
C144  100nF  [CAP-0201]
C148  0.1uF  [Cap-0402]
C149  1uF  [CAP-0201]
C168  100nF  [CAP-0201]
C169  1uF  [CAP-0201]
R93  0R  [Res-0402]
U1  RK3566  [BGA-565(15.5x14.4)]  (parts M,P of 22)

### Ports
GND (see DRAM_LPDDR4_SHEET[6D], eMMC_SPI-FLASH_SHEET[1D], HDMI2.0_SHEET[3D], HDMI_TO_TYPE-C_SHEET[5D], POWER_LDO_SHEET[3D], POWER_OTHER_SHEET[3C], POWER_PMIC_RK809_CODEC[3C], POWER_PMIC_RK809_DC DC[3D], POWER_PMIC_RK809_LDO[4C], POWER_PMIC_RK809_MGM[3D], RK3566_AUDIO_SHEET[3C], RK3566_DDR-PHY_SHEET[5D], RK3566_FLASH-SD_SHEET[4C], RK3566_OSC_PMUIO_SHEET[5D], RK3566_POWER_SHEET[3D], RK3566_SARADC_GPIO[3D], RK3566_USB_PCIe_SHEET[3D], RK3566_VO_SHEET_1[3C], RK3566_VO_SHEET_2[4C], TYPE-C_INTERFACE_SHEET[3D], USB2.0_SHEET[3D], WIFI-6_SHEET[3D]), VCC_1V8 (see HDMI_TO_TYPE-C_SHEET[5D], POWER_PMIC_RK809_LDO[4C], RK3566_SARADC_GPIO[3D], WIFI-6_SHEET[3D]), VCCA1V8_IMAGE (see POWER_PMIC_RK809_LDO[4C], RK3566_VO_SHEET_1[3C]), VDDA0V9_IMAGE (see POWER_PMIC_RK809_LDO[4C], RK3566_VO_SHEET_1[3C])

### Nets
GND: C144.1 C148.1 C149.2 C168.1 C169.2 ; port GND
VCC_1V8: R93.2 ; port VCC_1V8
VCCA1V8_IMAGE: C168.2 C169.1 U1.1P9(MIPI_CSI_RX_AVDD_1V8) ; port VCCA1V8_IMAGE
VCCIO6: C144.2 R93.1 U1.1L4(VCCIO6_1) U1.1L5(VCCIO6_2)
VDDA0V9_IMAGE: C148.2 C149.1 U1.1N9(MIPI_CSI_RX_AVDD_0V9) ; port VDDA0V9_IMAGE

Not connected (* = marked no-connect by the designer): U1 1L1(CIF_HREF/EBC_SDLE/GMAC1_MDC_M1/UART1_~{RTS}_M1/I2S2_MCLK_M1/GPIO4_B6_D)* 1L2(CAM_CLKOUT1/EBC_SDCE2/GMAC1_RXD1_M1/SPI3_MISO_M0/I2S1_SDO1_M1/GPIO4_B0_D)* 1N1(CAM_CLKOUT0/EBC_SDCE1/GMAC1_RXD0_M1/SPI3_CS1_M0/I2S1_LRCK_RX_M1/GPIO4_A7_D)* 1N2(CIF_D14/EBC_SDDO14/GMAC1_TXD0_M1/UART9_TX_M2/I2S2_LRCK_TX_M1/GPIO4_A4_D)* 1P2(CIF_D11/EBC_SDDO11/GMAC1_RXD2_M1/PDM_SDI1_M1/GPIO4_A1_D)* 1R1(CIF_D12/EBC_SDDO12/GMAC1_RXD3_M1/UART7_TX_M2/PDM_SDI2_M1/GPIO4_A2_D)* 1R2(CIF_D6/EBC_SDDO6/SDMMC2_DET_M0/I2S1_SDI2_M1/VOP_BT656_D6_M1/GPIO3_D4_D)* 1T1(CIF_D7/EBC_SDDO7/SDMMC2_PWREN_M0/I2S1_SDI3_M1/VOP_BT656_D7_M1/GPIO3_D5_D)* 1T2(CIF_D0/EBC_SDDO0/SDMMC2_D0_M0/I2S1_MCLK_M1/VOP_BT656_D0_M1/GPIO3_C6_D)* 1U1(CIF_D1/EBC_SDDO1/SDMMC2_D1_M0/I2S1_SCLK_TX_M1/VOP_BT656_D1_M1/GPIO3_C7_D)* 1U8(MIPI_CSI_RX_CLK1N)* 1U9(MIPI_CSI_RX_CLK0N)* 1V8(MIPI_CSI_RX_CLK1P)* 1V9(MIPI_CSI_RX_CLK0P)* AB1(CIF_CLKIN/EBC_SDCLK/GMAC1_MCLKINOUT_M1/UART1_~{CTS}_M1/I2S2_SCLK_RX_M1/GPIO4_C1_D)* AB2(CIF_CLKOUT/EBC_GDCLK/PWM11_IR_M1/GPIO4_C0_D)* AC2(CIF_VSYNC/EBC_SDOE/GMAC1_MDIO_M1/I2S2_SCLK_TX_M1/GPIO4_B7_D)* AD1(I2C2_SCL_M1/EBC_SDSHR/I2S1_SDO3_M1/GPIO4_B5_D)* AE2(I2C4_SCL_M0/EBC_GDOE/ETH1_REFCLKO_25M_M1/SPI3_CLK_M0/I2S2_SDO_M1/GPIO4_B3_D)* AF1(I2C2_SDA_M1/EBC_GDSP/ISP_FLASH_TRIGIN/VOP_BT656_CLK_M1/GPIO4_B4_D)* AF2(I2C4_SDA_M0/EBC_VCOM/GMAC1_RXER_M1/SPI3_MOSI_M0/I2S2_SDI_M1/GPIO4_B2_D)* AG2(ISP_PRELIGHT_TRIG/EBC_SDCE3/GMAC1_RXDV_CRS_M1/I2S1_SDO2_M1/GPIO4_B1_D)* AH2(ISP_FLASHTRIGOUT/EBC_SDCE0/GMAC1_TXEN_M1/SPI3_CS0_M0/I2S1_SCLK_RX_M1/GPIO4_A6_D)* AJ1(CIF_D15/EBC_SDDO15/GMAC1_TXD1_M1/UART9_RX_M2/I2S2_LRCK_RX_M1/GPIO4_A5_D)* AJ2(CIF_D13/EBC_SDDO13/GMAC1_RXCLK_M1/UART7_RX_M2/PDM_SDI3_M1/GPIO4_A3_D)* AK2(CIF_D10/EBC_SDDO10/GMAC1_TXCLK_M1/PDM_CLK1_M1/GPIO4_A0_D)* AL1(CIF_D9/EBC_SDDO9/GMAC1_TXD3_M1/UART1_RX_M1/PDM_SDI0_M1/GPIO3_D7_D)* AL2(CIF_D8/EBC_SDDO8/GMAC1_TXD2_M1/UART1_TX_M1/PDM_CLK0_M1/GPIO3_D6_D)* AM1(CIF_D5/EBC_SDDO5/SDMMC2_CLK_M0/I2S1_SDI1_M1/VOP_BT656_D5_M1/GPIO3_D3_D)* AM2(CIF_D4/EBC_SDDO4/SDMMC2_CMD_M0/I2S1_SDI0_M1/VOP_BT656_D4_M1/GPIO3_D2_D)* AN2(CIF_D3/EBC_SDDO3/SDMMC2_D3_M0/I2S1_SDO0_M1/VOP_BT656_D3_M1/GPIO3_D1_D)* AP1(CIF_D2/EBC_SDDO2/SDMMC2_D2_M0/I2S1_LRCK_TX_M1/VOP_BT656_D2_M1/GPIO3_D0_D)* AP14(MIPI_CSI_RX_D3N)* AP15(MIPI_CSI_RX_D2P)* AP17(MIPI_CSI_RX_D1N)* AP18(MIPI_CSI_RX_D0P)* AR14(MIPI_CSI_RX_D3P)* AR15(MIPI_CSI_RX_D2N)* AR17(MIPI_CSI_RX_D1P)* AR18(MIPI_CSI_RX_D0N)*

### Notes on the sheet
- RK3566_VI_INTERFACE
- RK3568 (MIPI CSI RX)
- RK3568 (VCCIO6 Domain)
- File:
- Title:
- Date:
- Page
- Num:
- Total:
- Drawn By: Huzaifa Ali
- (in symbol RK3566, part M) VCCIO6 Domain; Operating Voltage = 1.8V/3.3V
- (in symbol RK3566, part P) MIPI  CSI  RX

### Library data of the parts
C144 C168 = CC0201KRX5R6BB104: as C108-C113 on sheet RK3566_DDR-PHY_SHEET; Supplier 1: Mouser; Manufacturer Part Number: CC0201KRX5R6BB104; RoHS: Yes; Category: Ceramic Capacitors; Stock 1: 824403; Pricing 1: 1=0.10000, 10=0.02400, 50=0.02400, 100=0.01900, 1000=0.01100, 10000=0.00900 (USD); Mount: Surface Mount; Case/Package: 0201; Case Code (Imperial): 0201; Case Code (Metric): 0603; Weight: 6E-06oz; Min Operating Temperature: -55°C; Max Operating Temperature: 85°C; Capacitance: 100nF; Dielectric: X5R; Voltage Rating (DC): 10V; Packaging: Tape and Reel; Termination: SMD/SMT; Resistor Type: Ceramic; Voltage Rating: 10V; Series: CC; Construction: Flat; Length: 0.6mm; Width: 0.012inch; Height: 0.3mm; Thickness: 0.013inch; Depth: 0.3mm; Radiation Hardening: No; Lead Free: Lead Free; Halogen Free: Halogen Free; RoHS Compliant: Yes; ComponentLink1URL: https://datasheet.ciiva.com/11587/upy-gphc-x5r-4v-to-50v-12-11587190.pdf?src-supplier=Avnet; ComponentLink1Description: https://datasheet.ciiva.com/11587/upy-gphc-x5r-4v-to-50v-12-11587190.pdf?src-supplier=Avnet; Supplier Part Number 1: 603-CC201KRX5R6BB104; LCSC Part Number: C190183
C148 = CC0402KRX5R6BB104: CAP CER 0.1UF 10V X5R 0402; Manufacturer: Yageo; Capacitance: 100nF; Tolerance: 10%; Dissipation Factor: 5%; Insulation Resistance: 10GR; Item Type: Capacitor; Supplier 1: Digi-Key; Manufacturer Part Number: CC0402KRX5R6BB104; RoHS: Yes; Category: Ceramic Capacitors; Stock 1: 6385580; Pricing 1: 1=0.10000, 10=0.02700, 50=0.01500, 100=0.01220, 500=0.00874, 1000=0.00687, 2500=0.00625, 5000=0.00575 (USD); Mount: Surface Mount; Case/Package: 0402; Case Code (Imperial): 0402; Case Code (Metric): 1005; Min Operating Temperature: -55°C; Max Operating Temperature: 85°C; Dielectric: X5R; Voltage Rating (DC): 10V; Packaging: Tape and Reel; Termination: SMD/SMT; Voltage Rating: 10V; Series: CC; Length: 1mm; Width: 0.02inch; Height: 0.5mm; Thickness: 0.022inch; Depth: 0.5mm; Radiation Hardening: No; Lead Free: Lead Free; Halogen Free: Halogen Free; RoHS Compliant: Yes; ComponentLink1URL: https://datasheet.ciiva.com/144/mlccorderingcode-144029.pdf?src-supplier=Digi-Key; ComponentLink1Description: https://datasheet.ciiva.com/144/mlccorderingcode-144029.pdf?src-supplier=Digi-Key; Supplier Part Number 1: 311-1336-1-ND; LCSC Part Number: C129131; Number of Pins: 2; Package Quantity: 1; REACH SVHC: No SVHC; ComponentLink2URL: https://datasheet.ciiva.com/144/mlccorderingcode-144028.pdf?src-supplier=Digi-Key; ComponentLink2Description: https://datasheet.ciiva.com/144/mlccorderingcode-144028.pdf?src-supplier=Digi-Key; ComponentLink3URL: https://datasheet.ciiva.com/144/mlccorderingcode-144030.pdf?src-supplier=Digi-Key; ComponentLink3Description: https://datasheet.ciiva.com/144/mlccorderingcode-144030.pdf?src-supplier=Digi-Key; ComponentLink4URL: https://datasheet.ciiva.com/7978/1359354-7978091.pdf?src-supplier=Element14; ComponentLink4Description: https://datasheet.ciiva.com/7978/1359354-7978091.pdf?src-supplier=Element14; ComponentLink5URL: https://datasheet.ciiva.com/11587/upy-gphc-x5r-4v-to-50v-12-11587302.pdf?src-supplier=Avnet; ComponentLink5Description: https://datasheet.ciiva.com/11587/upy-gphc-x5r-4v-to-50v-12-11587302.pdf?src-supplier=Avnet
C149 C169 = CC0201MRX5R6BB105: CAP CER 1UF 10V X5R 0201; Manufacturer: Yageo; Item Type: Capacitor; Manufacturer Part Number: CC0201MRX5R6BB105; RoHS: Yes; Category: Ceramic Capacitors; ComponentLink1URL: https://datasheet.octopart.com/CC0201MRX5R6BB105-Yageo-datasheet-158238148.pdf?src-supplier=Farnell; ComponentLink1Description: https://datasheet.octopart.com/CC0201MRX5R6BB105-Yageo-datasheet-158238148.pdf?src-supplier=Farnell; ComponentLink2URL: http://www.yageo.com/documents/recent/UPY-GPHC_X5R_4V-to-50V_25.pdf?src-supplier=Digi-Key; ComponentLink2Description: http://www.yageo.com/documents/recent/UPY-GPHC_X5R_4V-to-50V_25.pdf?src-supplier=Digi-Key; ComponentLink3URL: https://datasheet.octopart.com/CC0201MRX5R6BB105-Yageo-datasheet-137700082.pdf?src-supplier=Future+Electronics; ComponentLink3Description: https://datasheet.octopart.com/CC0201MRX5R6BB105-Yageo-datasheet-137700082.pdf?src-supplier=Future+Electronics; LCSC Part Number: C605210; Supplier: Digi-Key; Supplier Part Number: 311-3474-1-ND; Stock: 772400; Pricing: 1=0.19, 10=0.135, 50=0.0764, 100=0.0633, 500=0.04436, 1000=0.03672, 2500=0.03418, 5000=0.03127 (USD)
R93 = RC0402FR-070RL: RES 0 OHM JUMPER 1/16W 0402; Manufacturer: Yageo; Item Type: Resistors; Tolerance: 1%; Power Rating: 62.5mW; Voltage Rating: 50V; Temperature Coefficient: 200ppm/°C; Max Power Dissipation: 63mW; Supplier 1: Mouser; Manufacturer Part Number: RC0402FR-070RL; RoHS: Yes; Stock 1: 8556842; Pricing 1: 1=0.10000, 10=0.01400, 50=0.01400, 100=0.00600, 1000=0.00300, 5000=0.00200, 10000=0.00100 (USD); Mount: Surface Mount; Case/Package: 0402; Contact Plating: Tin,Matte; Case Code (Imperial): 0402; Case Code (Metric): 1005; Size Code: 0402; Min Operating Temperature: -55°C; Max Operating Temperature: 155°C; Resistance: 0R; Resistor Type: Thick Film; Packaging: Tape and Reel; Termination: SMD/SMT; Features: Moisture Resistant; Series: RC; Number of Terminations: 2; Length: 1mm; Width: 0.5mm; Height: 0.35mm; Radiation Hardening: No; Lead Free: Lead Free; RoHS Compliant: Yes; ComponentLink1URL: https://datasheet.ciiva.com/8896/pyu-rc0402-51-rohs-l-6-8896149.pdf?src-supplier=Avnet; ComponentLink1Description: https://datasheet.ciiva.com/8896/pyu-rc0402-51-rohs-l-6-8896149.pdf?src-supplier=Avnet; ComponentLink2URL: https://datasheet.ciiva.com/16790/pyu-rc0402-51-rohs-l-6-r-16790444.pdf?src-supplier=Future+Electronics; ComponentLink2Description: https://datasheet.ciiva.com/16790/pyu-rc0402-51-rohs-l-6-r-16790444.pdf?src-supplier=Future+Electronics; Supplier Part Number 1: 603-RC0402FR-070RL; LCSC Part Number: C106231
U1 = RK3566: as U1 on sheet RK3566_SARADC_GPIO; Manufacturer Part Number: RK3566; Package: BGA-565(15.5x14.4); LCSC Part Number: C2943786; ComponentLink1Description: LCSC; ComponentLink1URL: https://www.lcsc.com/product-detail/Microcontrollers-MCU-MPU-SOC_Rockchip-RK3566_C2943786.html

## Sheet RK3566_VO_SHEET_1.SchDoc
size A4; SheetNumber: 15; SheetTotal: 23
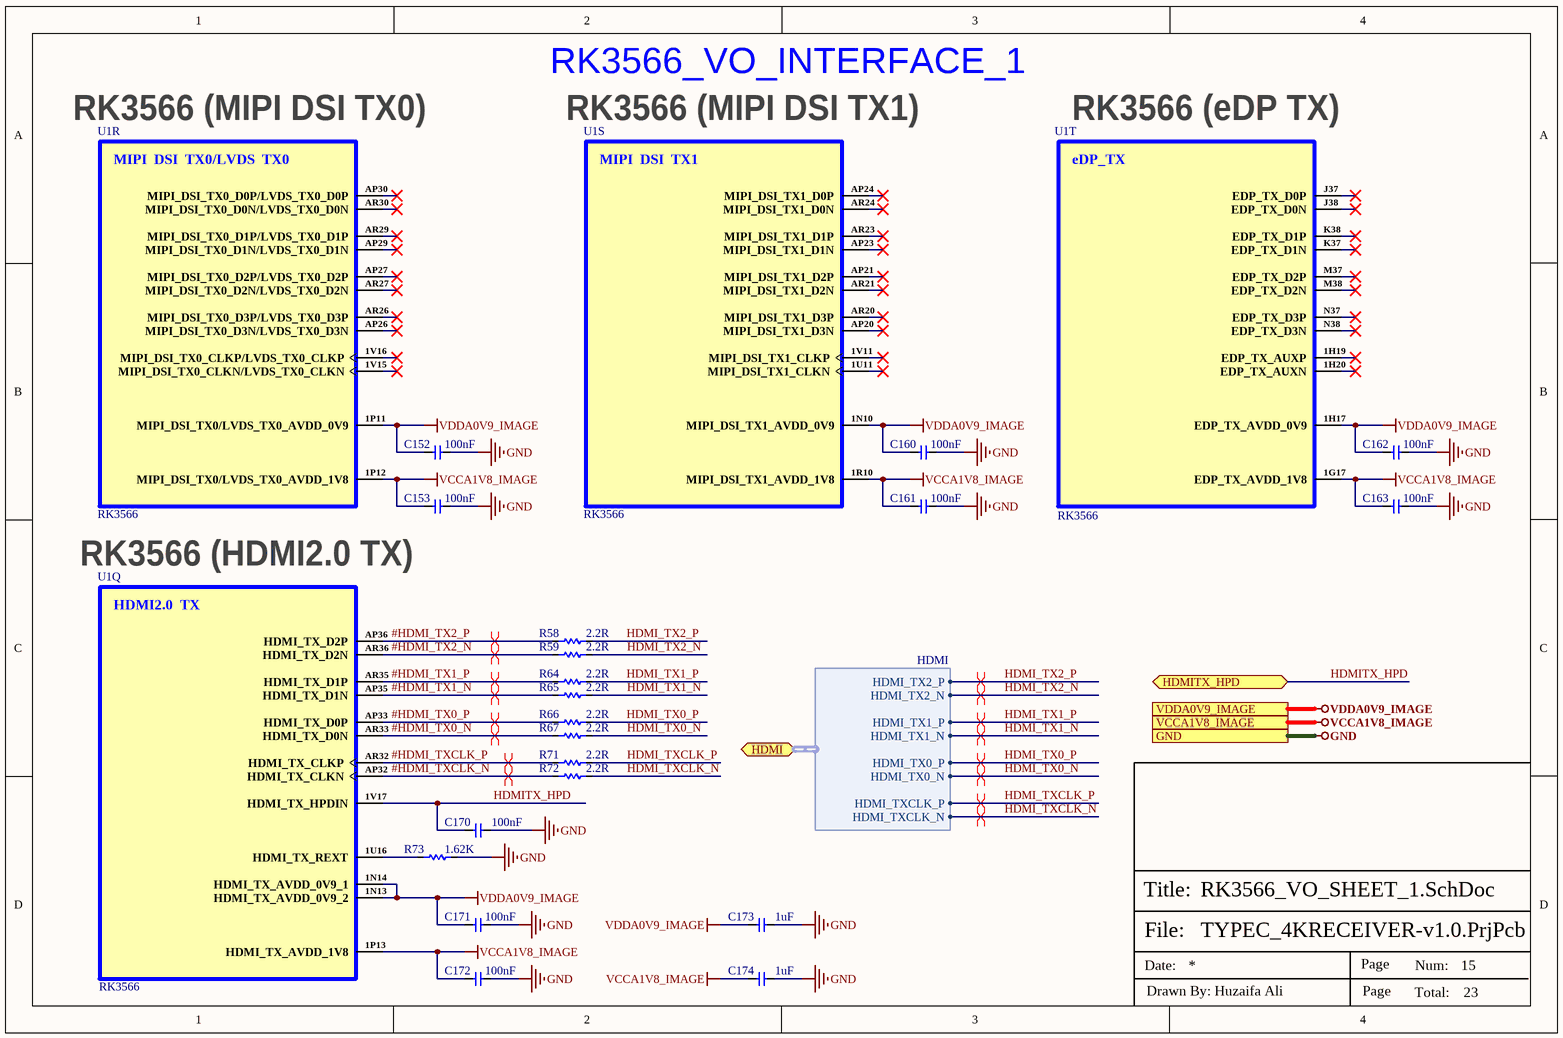
[diagram p15: RK3566_VO_SHEET_1.SchDoc]

### Parts
C152  100nF  [CAP-0201]
C153  100nF  [CAP-0201]
C160  100nF  [CAP-0201]
C161  100nF  [CAP-0201]
C162  100nF  [CAP-0201]
C163  100nF  [CAP-0201]
C170  100nF  [CAP-0201]
C171  100nF  [CAP-0201]
C172  100nF  [CAP-0201]
C173  1uF  [Cap-0402]
C174  1uF  [CAP-0201]
R58  2.2R  [Res-0201]
R59  2.2R  [Res-0201]
R64  2.2R  [Res-0201]
R65  2.2R  [Res-0201]
R66  2.2R  [Res-0201]
R67  2.2R  [Res-0201]
R71  2.2R  [Res-0201]
R72  2.2R  [Res-0201]
R73  1.62K  [Res-0201]
U1  RK3566  [BGA-565(15.5x14.4)]  (parts Q,R,S,T of 22)

### Ports
GND (see DRAM_LPDDR4_SHEET[6D], eMMC_SPI-FLASH_SHEET[1D], HDMI2.0_SHEET[3D], POWER_LDO_SHEET[3D], POWER_OTHER_SHEET[3C], POWER_PMIC_RK809_CODEC[3C], POWER_PMIC_RK809_DC DC[3D], POWER_PMIC_RK809_LDO[4C], POWER_PMIC_RK809_MGM[3D], RK3566_AUDIO_SHEET[3C], RK3566_DDR-PHY_SHEET[5D], RK3566_FLASH-SD_SHEET[4C], RK3566_OSC_PMUIO_SHEET[5D], RK3566_POWER_SHEET[3D], RK3566_SARADC_GPIO[3D], RK3566_USB_PCIe_SHEET[3D], RK3566_VI_SHEET[3D], RK3566_VO_SHEET_2[4C], TYPE-C_INTERFACE_SHEET[3D], TYPE-C_TO_MIPI-CSI_SHEET[5D], USB2.0_SHEET[3D], WIFI-6_SHEET[3D]), HDMI (bidir, harness HDMI, see HDMI2.0_SHEET[2D]), HDMITX_HPD (bidir, see HDMI2.0_SHEET[3D]), VCCA1V8_IMAGE (see POWER_PMIC_RK809_LDO[4C], RK3566_VI_SHEET[3D]), VDDA0V9_IMAGE (see POWER_PMIC_RK809_LDO[4C], RK3566_VI_SHEET[3D])

### Harnesses
HDMI: HDMI_TX2_P, HDMI_TX2_N, HDMI_TX1_P, HDMI_TX1_N, HDMI_TX0_P, HDMI_TX0_N, HDMI_TXCLK_P, HDMI_TXCLK_N

### Nets
GND: C152.1 C153.1 C160.1 C161.1 C162.1 C163.1 C170.1 C171.1 C172.1 C173.1 C174.1 R73.2 ; port GND
VCCA1V8_IMAGE: C153.2 C161.2 C163.2 C172.2 C174.2 U1.1G17(EDP_TX_AVDD_1V8) U1.1P12(MIPI_DSI_TX0/LVDS_TX0_AVDD_1V8) U1.1P13(HDMI_TX_AVDD_1V8) U1.1R10(MIPI_DSI_TX1_AVDD_1V8) ; port VCCA1V8_IMAGE
VDDA0V9_IMAGE: C152.2 C160.2 C162.2 C171.2 C173.2 U1.1H17(EDP_TX_AVDD_0V9) U1.1N10(MIPI_DSI_TX1_AVDD_0V9) U1.1N13(HDMI_TX_AVDD_0V9_2) U1.1N14(HDMI_TX_AVDD_0V9_1) U1.1P11(MIPI_DSI_TX0/LVDS_TX0_AVDD_0V9) ; port VDDA0V9_IMAGE
#HDMI_TX0_N: R67.1 U1.AR33(HDMI_TX_D0N)
#HDMI_TX0_P: R66.1 U1.AP33(HDMI_TX_D0P)
#HDMI_TX1_N: R65.1 U1.AP35(HDMI_TX_D1N)
#HDMI_TX1_P: R64.1 U1.AR35(HDMI_TX_D1P)
#HDMI_TX2_N: R59.1 U1.AR36(HDMI_TX_D2N)
#HDMI_TX2_P: R58.1 U1.AP36(HDMI_TX_D2P)
#HDMI_TXCLK_N: R72.1 U1.AP32(HDMI_TX_CLKN)
#HDMI_TXCLK_P: R71.1 U1.AR32(HDMI_TX_CLKP)
HDMI_TX0_N: R67.2 ; port HDMI.HDMI_TX0_N
HDMI_TX0_P: R66.2 ; port HDMI.HDMI_TX0_P
HDMI_TX1_N: R65.2 ; port HDMI.HDMI_TX1_N
HDMI_TX1_P: R64.2 ; port HDMI.HDMI_TX1_P
HDMI_TX2_N: R59.2 ; port HDMI.HDMI_TX2_N
HDMI_TX2_P: R58.2 ; port HDMI.HDMI_TX2_P
HDMI_TXCLK_N: R72.2 ; port HDMI.HDMI_TXCLK_N
HDMI_TXCLK_P: R71.2 ; port HDMI.HDMI_TXCLK_P
HDMITX_HPD: C170.2 U1.1V17(HDMI_TX_HPDIN) ; port HDMITX_HPD
NetR73_1: R73.1 U1.1U16(HDMI_TX_REXT)

Not connected (* = marked no-connect by the designer): U1 1H19(EDP_TX_AUXP)* 1H20(EDP_TX_AUXN)* 1U11(MIPI_DSI_TX1_CLKN)* 1V11(MIPI_DSI_TX1_CLKP)* 1V15(MIPI_DSI_TX0_CLKN/LVDS_TX0_CLKN)* 1V16(MIPI_DSI_TX0_CLKP/LVDS_TX0_CLKP)* AP20(MIPI_DSI_TX1_D3N)* AP21(MIPI_DSI_TX1_D2P)* AP23(MIPI_DSI_TX1_D1N)* AP24(MIPI_DSI_TX1_D0P)* AP26(MIPI_DSI_TX0_D3N/LVDS_TX0_D3N)* AP27(MIPI_DSI_TX0_D2P/LVDS_TX0_D2P)* AP29(MIPI_DSI_TX0_D1N/LVDS_TX0_D1N)* AP30(MIPI_DSI_TX0_D0P/LVDS_TX0_D0P)* AR20(MIPI_DSI_TX1_D3P)* AR21(MIPI_DSI_TX1_D2N)* AR23(MIPI_DSI_TX1_D1P)* AR24(MIPI_DSI_TX1_D0N)* AR26(MIPI_DSI_TX0_D3P/LVDS_TX0_D3P)* AR27(MIPI_DSI_TX0_D2N/LVDS_TX0_D2N)* AR29(MIPI_DSI_TX0_D1P/LVDS_TX0_D1P)* AR30(MIPI_DSI_TX0_D0N/LVDS_TX0_D0N)* J37(EDP_TX_D0P)* J38(EDP_TX_D0N)* K37(EDP_TX_D1N)* K38(EDP_TX_D1P)* M37(EDP_TX_D2P)* M38(EDP_TX_D2N)* N37(EDP_TX_D3P)* N38(EDP_TX_D3N)*

### Layout directives
differential pair; differential pair class HDMI_100R: #HDMI_TX0_N, #HDMI_TX0_P, #HDMI_TX1_N, #HDMI_TX1_P, #HDMI_TX2_N, #HDMI_TX2_P, #HDMI_TXCLK_N, #HDMI_TXCLK_P, HDMI_TX0_N, HDMI_TX0_P, HDMI_TX1_N, HDMI_TX1_P, HDMI_TX2_N, HDMI_TX2_P, HDMI_TXCLK_N, HDMI_TXCLK_P

### Notes on the sheet
- RK3566 (MIPI DSI TX0)
- RK3566 (MIPI DSI TX1)
- RK3566_VO_INTERFACE_1
- RK3566 (eDP TX)
- (near C153) RK3566 (HDMI2.0 TX)
- File:
- Title:
- Date:
- Page
- Num:
- Total:
- Drawn By: Huzaifa Ali
- (in symbol RK3566, part Q) HDMI2.0  TX
- (in symbol RK3566, part R) MIPI  DSI  TX0/LVDS  TX0
- (in symbol RK3566, part S) MIPI  DSI  TX1
- (in symbol RK3566, part T) eDP_TX

### Library data of the parts
C152 C153 C160-C163 C170-C172 = CC0201KRX5R6BB104: as C108-C113 on sheet RK3566_DDR-PHY_SHEET; Supplier 1: Mouser; Manufacturer Part Number: CC0201KRX5R6BB104; RoHS: Yes; Category: Ceramic Capacitors; Stock 1: 824403; Pricing 1: 1=0.10000, 10=0.02400, 50=0.02400, 100=0.01900, 1000=0.01100, 10000=0.00900 (USD); Mount: Surface Mount; Case/Package: 0201; Case Code (Imperial): 0201; Case Code (Metric): 0603; Weight: 6E-06oz; Min Operating Temperature: -55°C; Max Operating Temperature: 85°C; Capacitance: 100nF; Dielectric: X5R; Voltage Rating (DC): 10V; Packaging: Tape and Reel; Termination: SMD/SMT; Resistor Type: Ceramic; Voltage Rating: 10V; Series: CC; Construction: Flat; Length: 0.6mm; Width: 0.012inch; Height: 0.3mm; Thickness: 0.013inch; Depth: 0.3mm; Radiation Hardening: No; Lead Free: Lead Free; Halogen Free: Halogen Free; RoHS Compliant: Yes; ComponentLink1URL: https://datasheet.ciiva.com/11587/upy-gphc-x5r-4v-to-50v-12-11587190.pdf?src-supplier=Avnet; ComponentLink1Description: https://datasheet.ciiva.com/11587/upy-gphc-x5r-4v-to-50v-12-11587190.pdf?src-supplier=Avnet; Supplier Part Number 1: 603-CC201KRX5R6BB104; LCSC Part Number: C190183
C173 = CC0402KRX5R6BB105: CAP CER 1UF 10V X5R 0402; Manufacturer: Yageo; Item Type: Capacitor; Tolerance: 10%; Dissipation Factor: 15%; Manufacturer Part Number: CC0402KRX5R6BB105; RoHS: Yes; Category: Ceramic Capacitors; ComponentLink1URL: https://datasheet.ciiva.com/176/upy-gphc-x5r-4v-to-50v-12-176704.pdf?src-supplier=Digi-Key; ComponentLink1Description: https://datasheet.ciiva.com/176/upy-gphc-x5r-4v-to-50v-12-176704.pdf?src-supplier=Digi-Key; ComponentLink2URL: https://datasheet.ciiva.com/176/mlccorderingcode-176705.pdf?src-supplier=Digi-Key; ComponentLink2Description: https://datasheet.ciiva.com/176/mlccorderingcode-176705.pdf?src-supplier=Digi-Key; LCSC Part Number: C106254; ComponentLink3URL: https://datasheet.ciiva.com/176/mlccorderingcode-176706.pdf?src-supplier=Digi-Key; ComponentLink3Description: https://datasheet.ciiva.com/176/mlccorderingcode-176706.pdf?src-supplier=Digi-Key; Supplier 1: Mouser; Stock 1: 6711367; Pricing 1: 1=0.11000, 10=0.05500, 50=0.05500, 100=0.03300, 500=0.02700, 1000=0.02200, 2500=0.02100, 10000=0.01800 (USD); Mount: Surface Mount; Case/Package: 0402; Number of Pins: 2; Case Code (Metric): 1005; Case Code (Imperial): 0402; Min Operating Temperature: -55°C; Max Operating Temperature: 85°C; Capacitance: 1uF; Dielectric: X5R; Package Quantity: 1; Voltage Rating: 10V; Packaging: Tape and Reel; Voltage Rating (DC): 10V; Termination: SMD/SMT; Resistor Type: Ceramic; Series: CC; Construction: Flat; Length: 1mm; Width: 0.02inch; Height: 0.5mm; Thickness: 0.022inch; Depth: 0.5mm; Radiation Hardening: No; REACH SVHC: No SVHC; Lead Free: Lead Free; Halogen Free: Halogen Free; RoHS Compliant: Yes; Supplier Part Number 1: 603-CC402KRX5R6BB105
C174 = CC0201MRX5R6BB105: as C149 on sheet RK3566_VI_SHEET; Manufacturer Part Number: CC0201MRX5R6BB105; RoHS: Yes; Category: Ceramic Capacitors; ComponentLink1URL: https://datasheet.octopart.com/CC0201MRX5R6BB105-Yageo-datasheet-158238148.pdf?src-supplier=Farnell; ComponentLink1Description: https://datasheet.octopart.com/CC0201MRX5R6BB105-Yageo-datasheet-158238148.pdf?src-supplier=Farnell; ComponentLink2URL: http://www.yageo.com/documents/recent/UPY-GPHC_X5R_4V-to-50V_25.pdf?src-supplier=Digi-Key; ComponentLink2Description: http://www.yageo.com/documents/recent/UPY-GPHC_X5R_4V-to-50V_25.pdf?src-supplier=Digi-Key; LCSC Part Number: C605210; Supplier: Digi-Key; Supplier Part Number: 311-3474-1-ND; Stock: 772400; Pricing: 1=0.19, 10=0.135, 50=0.0764, 100=0.0633, 500=0.04436, 1000=0.03672, 2500=0.03418, 5000=0.03127 (USD); ComponentLink3URL: https://datasheet.octopart.com/CC0201MRX5R6BB105-Yageo-datasheet-137700082.pdf?src-supplier=Future+Electronics; ComponentLink3Description: https://datasheet.octopart.com/CC0201MRX5R6BB105-Yageo-datasheet-137700082.pdf?src-supplier=Future+Electronics
R58 R59 R64-R67 R71 R72 = 0201WMF220KTEE: 50mW Thick Film Resistors 25V ±1% -100ppm/℃~+350ppm/℃ 2.2Ω 0201 Chip Resistor - Surface Mount ROHS; Manufacturer: UNI-ROYAL; Manufacturer Part Number: 0201WMF220KTEE; ComponentLink1URL: https://www.lcsc.com/product-detail/Chip-Resistor-Surface-Mount_UNI-ROYAL-Uniroyal-Elec-0201WMF220KTEE_C473517.html; ComponentLink1Description: LCSC; LCSC Part Number: C473517; Package: 0201; Item Type: Resistor
R73 = RC0201DR-071K62L: RES 1.62K OHM 0.5% 1/20W 0201; Manufacturer: Yageo; Value: 1.62kR; Max Power Dissipation: 50mW; Temperature Coefficient: 200ppm/°C; Item Type: Resistor; Supplier: Avnet; Supplier Part Number: RC0201DR-071K62L; Manufacturer Part Number: RC0201DR-071K62L; RoHS: Yes; Category: Chip SMD Resistors; Pricing: 10000=0.01131 (USD); Case/Package: 0201; Min Operating Temperature: -55°C; Max Operating Temperature: 125°C; Packaging: Tape and Reel; Number of Terminations: 2; Tolerance: 0.5%; Features: Moisture Resistant; Series: RC; Length: 0.024inch; Width: 0.012inch; Height: 0.01inch; RoHS Compliant: Yes; ComponentLink1URL: http://www.yageo.com.tw/exep/pages/download/literatures/PYu-R_INT-thick_7.pdf?src-supplier=Digikey; ComponentLink1Description: http://www.yageo.com.tw/exep/pages/download/literatures/PYu-R_INT-thick_7.pdf?src-supplier=Digikey; LCSC Part Number: C851673
U1 = RK3566: as U1 on sheet RK3566_SARADC_GPIO; Manufacturer Part Number: RK3566; Package: BGA-565(15.5x14.4); LCSC Part Number: C2943786; ComponentLink1Description: LCSC; ComponentLink1URL: https://www.lcsc.com/product-detail/Microcontrollers-MCU-MPU-SOC_Rockchip-RK3566_C2943786.html